# Altium project Sound_Sensor.PrjPcb (part 4 of 4)

## Sheet Sensor_Sheet_2.SchDoc
size A4; DocumentNumber: 4; SheetNumber: 4; SheetTotal: 11
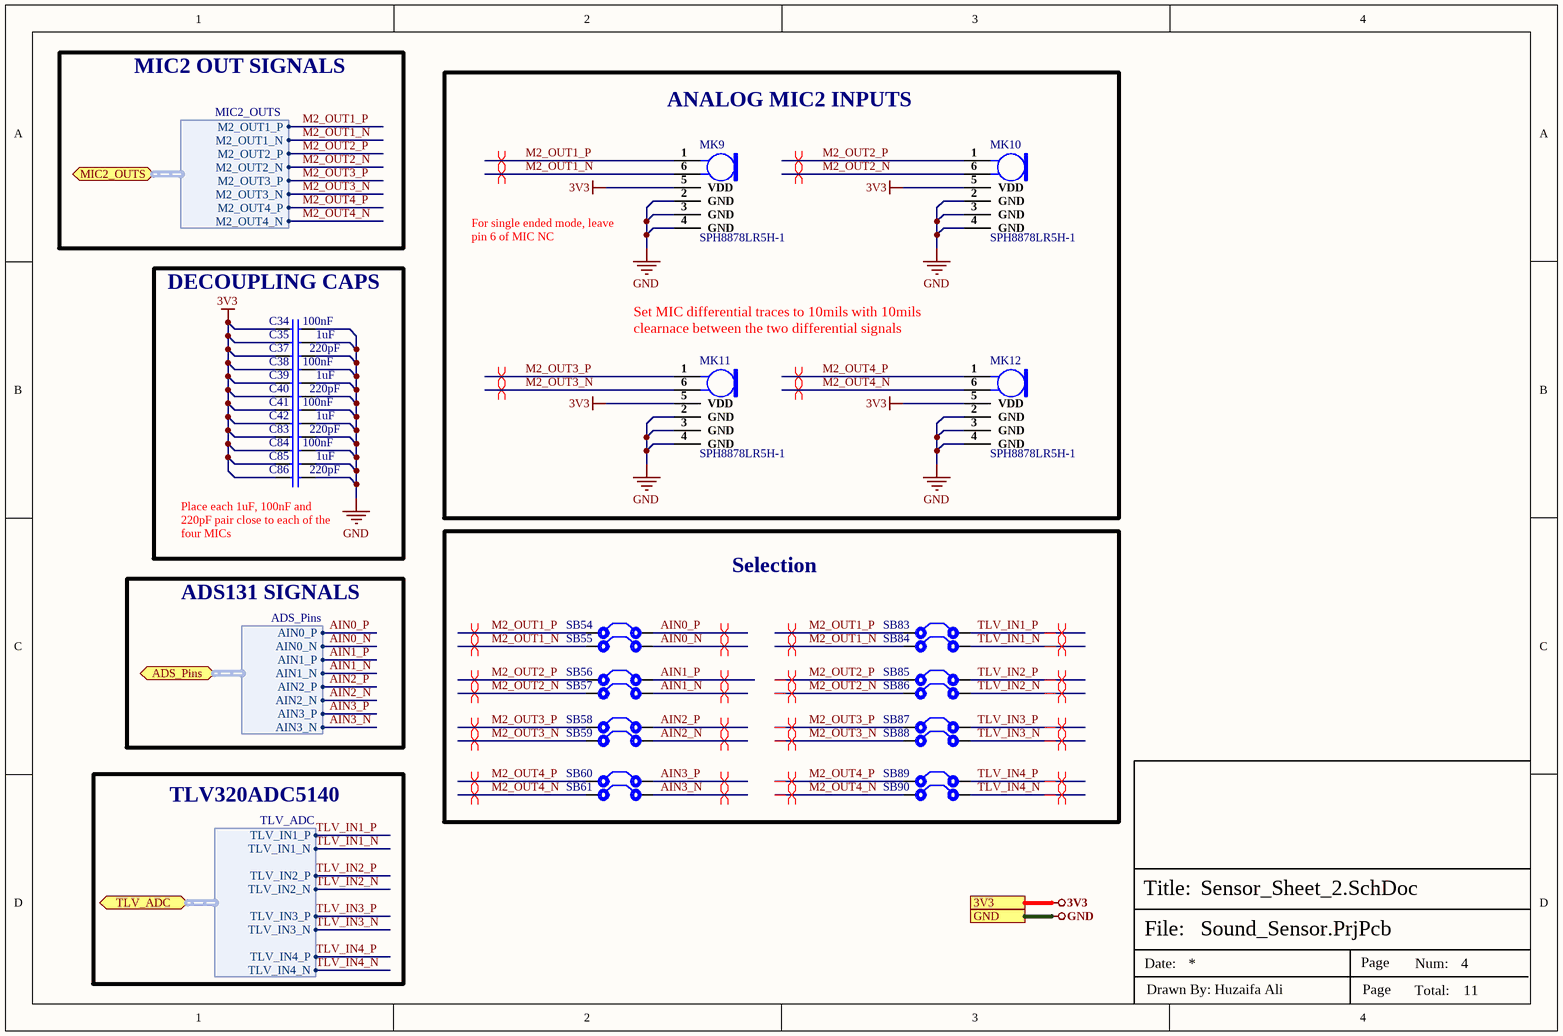
[diagram p9: Sensor_Sheet_2.SchDoc]

### Parts
C34  100nF  [Cap-0603]
C35  1uF  [Cap-0402]
C37  220pF  [Cap 0402]
C38  100nF  [Cap-0603]
C39  1uF  [Cap-0402]
C40  220pF  [Cap 0402]
C41  100nF  [Cap-0603]
C42  1uF  [Cap-0402]
C83  220pF  [Cap 0402]
C84  100nF  [Cap-0603]
C85  1uF  [Cap-0402]
C86  220pF  [Cap 0402]
MK9  SPH8878LR5H-1  [SPH8878LR5H-1]
MK10  SPH8878LR5H-1  [SPH8878LR5H-1]
MK11  SPH8878LR5H-1  [SPH8878LR5H-1]
MK12  SPH8878LR5H-1  [SPH8878LR5H-1]
SB54  Solder Bridge  [Solder Bridge]  (value not drawn)
SB55  Solder Bridge  [Solder Bridge]  (value not drawn)
SB56  Solder Bridge  [Solder Bridge]  (value not drawn)
SB57  Solder Bridge  [Solder Bridge]  (value not drawn)
SB58  Solder Bridge  [Solder Bridge]  (value not drawn)
SB59  Solder Bridge  [Solder Bridge]  (value not drawn)
SB60  Solder Bridge  [Solder Bridge]  (value not drawn)
SB61  Solder Bridge  [Solder Bridge]  (value not drawn)
SB83  Solder Bridge  [Solder Bridge]  (value not drawn)
SB84  Solder Bridge  [Solder Bridge]  (value not drawn)
SB85  Solder Bridge  [Solder Bridge]  (value not drawn)
SB86  Solder Bridge  [Solder Bridge]  (value not drawn)
SB87  Solder Bridge  [Solder Bridge]  (value not drawn)
SB88  Solder Bridge  [Solder Bridge]  (value not drawn)
SB89  Solder Bridge  [Solder Bridge]  (value not drawn)
SB90  Solder Bridge  [Solder Bridge]  (value not drawn)

### Blocks framed on the sheet
ANALOG MIC2 INPUTS: MK9-MK12
DECOUPLING CAPS: C34 C35 C37-C42 C83-C86
Selection: SB54-SB61 SB83-SB90

### Ports
3V3, ADS_Pins (bidir, harness ADS_Pins), GND, MIC2_OUTS (bidir, harness MIC2_OUTS), TLV_ADC (bidir, harness TLV_ADC)

### Harnesses
ADS_Pins: AIN2_P, AIN2_N, AIN3_N, AIN3_P, AIN0_P, AIN0_N, AIN1_N, AIN1_P
TLV_ADC: TLV_IN1_P, TLV_IN1_N, TLV_IN2_P, TLV_IN2_N, TLV_IN3_P, TLV_IN3_N, TLV_IN4_P, TLV_IN4_N
MIC2_OUTS: M2_OUT2_P, M2_OUT1_P, M2_OUT1_N, M2_OUT2_N, M2_OUT4_P, M2_OUT3_P, M2_OUT3_N, M2_OUT4_N

### Nets
3V3: C34.1 C35.1 C37.1 C38.1 C39.1 C40.1 C41.1 C42.1 C83.1 C84.1 C85.1 C86.1 MK9.5(VDD) MK10.5(VDD) MK11.5(VDD) MK12.5(VDD) ; port 3V3
GND: C34.2 C35.2 C37.2 C38.2 C39.2 C40.2 C41.2 C42.2 C83.2 C84.2 C85.2 C86.2 MK9.2(GND) MK9.3(GND) MK9.4(GND) MK10.2(GND) MK10.3(GND) MK10.4(GND) MK11.2(GND) MK11.3(GND) MK11.4(GND) MK12.2(GND) MK12.3(GND) MK12.4(GND) ; port GND
AIN0_N: SB55.2 ; port ADS_Pins.AIN0_N  [project net ADS_Pins.AIN0_N]
AIN0_P: SB54.2 ; port ADS_Pins.AIN0_P  [project net ADS_Pins.AIN0_P]
AIN1_N: SB57.2 ; port ADS_Pins.AIN1_N  [project net ADS_Pins.AIN1_N]
AIN1_P: SB56.2 ; port ADS_Pins.AIN1_P  [project net ADS_Pins.AIN1_P]
AIN2_N: SB59.2 ; port ADS_Pins.AIN2_N  [project net ADS_Pins.AIN2_N]
AIN2_P: SB58.2 ; port ADS_Pins.AIN2_P  [project net ADS_Pins.AIN2_P]
AIN3_N: SB61.2 ; port ADS_Pins.AIN3_N  [project net ADS_Pins.AIN3_N]
AIN3_P: SB60.2 ; port ADS_Pins.AIN3_P  [project net ADS_Pins.AIN3_P]
M2_OUT1_N: MK9.6(OUT-) SB55.1 SB84.1 ; port MIC2_OUTS.M2_OUT1_N
M2_OUT1_P: MK9.1(OUT+) SB54.1 SB83.1 ; port MIC2_OUTS.M2_OUT1_P
M2_OUT2_N: MK10.6(OUT-) SB57.1 SB86.1 ; port MIC2_OUTS.M2_OUT2_N
M2_OUT2_P: MK10.1(OUT+) SB56.1 SB85.1 ; port MIC2_OUTS.M2_OUT2_P
M2_OUT3_N: MK11.6(OUT-) SB59.1 SB88.1 ; port MIC2_OUTS.M2_OUT3_N
M2_OUT3_P: MK11.1(OUT+) SB58.1 SB87.1 ; port MIC2_OUTS.M2_OUT3_P
M2_OUT4_N: MK12.6(OUT-) SB61.1 SB90.1 ; port MIC2_OUTS.M2_OUT4_N
M2_OUT4_P: MK12.1(OUT+) SB60.1 SB89.1 ; port MIC2_OUTS.M2_OUT4_P
TLV_IN1_N: SB84.2 ; port TLV_ADC.TLV_IN1_N  [project net TLV_ADC.TLV_IN1_N]
TLV_IN1_P: SB83.2 ; port TLV_ADC.TLV_IN1_P  [project net TLV_ADC.TLV_IN1_P]
TLV_IN2_N: SB86.2 ; port TLV_ADC.TLV_IN2_N  [project net TLV_ADC.TLV_IN2_N]
TLV_IN2_P: SB85.2 ; port TLV_ADC.TLV_IN2_P  [project net TLV_ADC.TLV_IN2_P]
TLV_IN3_N: SB88.2 ; port TLV_ADC.TLV_IN3_N  [project net TLV_ADC.TLV_IN3_N]
TLV_IN3_P: SB87.2 ; port TLV_ADC.TLV_IN3_P  [project net TLV_ADC.TLV_IN3_P]
TLV_IN4_N: SB90.2 ; port TLV_ADC.TLV_IN4_N  [project net TLV_ADC.TLV_IN4_N]
TLV_IN4_P: SB89.2 ; port TLV_ADC.TLV_IN4_P  [project net TLV_ADC.TLV_IN4_P]

### Layout directives
differential pair; net class OUT1; differential pair class OUT1_Lines: M2_OUT1_N, M2_OUT1_P, M2_OUT2_N, M2_OUT2_P, M2_OUT3_N, M2_OUT3_P, M2_OUT4_N, M2_OUT4_P
differential pair; net class AIN0; differential pair class AIN0_Lines: ADS_Pins.AIN0_N, ADS_Pins.AIN0_P
differential pair; net class AIN1; differential pair class AIN1_Lines: ADS_Pins.AIN1_N, ADS_Pins.AIN1_P
differential pair; net class AIN2; differential pair class AIN2_Lines: ADS_Pins.AIN2_N, ADS_Pins.AIN2_P
differential pair; net class AIN3; differential pair class AIN3_Lines: ADS_Pins.AIN3_N, ADS_Pins.AIN3_P
differential pair; net class M2_OUT1; differential pair class M2_OUT1_Lines: M2_OUT1_N, M2_OUT1_P
differential pair; net class M2_OUT2; differential pair class M2_OUT2_Lines: M2_OUT2_N, M2_OUT2_P
differential pair; net class M2_OUT3; differential pair class M2_OUT3_Lines: M2_OUT3_N, M2_OUT3_P
differential pair; net class M2_OUT4; differential pair class M2_OUT4_Lines: M2_OUT4_N, M2_OUT4_P
differential pair; net class TLV_IN1; differential pair class TLV_IN1_Lines: TLV_ADC.TLV_IN1_N, TLV_ADC.TLV_IN1_P
differential pair; net class TLV_IN2; differential pair class TLV_IN2_Lines: TLV_ADC.TLV_IN2_N, TLV_ADC.TLV_IN2_P
differential pair; net class TLV_IN3; differential pair class TLV_IN3_Lines: TLV_ADC.TLV_IN3_N, TLV_ADC.TLV_IN3_P
differential pair; net class TLV_IN4; differential pair class TLV_IN4_Lines: TLV_ADC.TLV_IN4_N, TLV_ADC.TLV_IN4_P

### Notes on the sheet
- MIC2 OUT SIGNALS
- For single ended mode, leave pin 6 of MIC NC
- (near MK11) Set MIC differential traces to 10mils with 10mils clearnace between the two differential signals
- Place each 1uF, 100nF and 220pF pair close to each of the four MICs
- ADS131 SIGNALS
- TLV320ADC5140
- File:
- Title:
- Date:
- Page
- Num:
- Total:
- Drawn By: Huzaifa Ali

### Library data of the parts
C34 C38 C41 C84 = CC0603KRX5R9BB104: CAP CER 0.1UF 50V X5R 0603; Manufacturer: Yageo; Tolerance: 10%; Item Type: Capacitor; Supplier 1: Digi-Key; Manufacturer Part Number: CC0603KRX5R9BB104; RoHS: Yes; Category: Ceramic Capacitors; Stock 1: 152253; Pricing 1: 1=0.10000, 10=0.05200, 50=0.02820, 100=0.02310, 500=0.01648, 1000=0.01294 (USD); Mount: Surface Mount; Case/Package: 0603; Case Code (Imperial): 0603; Case Code (Metric): 1608; Weight: 7.1E-05oz; Min Operating Temperature: -55°C; Max Operating Temperature: 85°C; Capacitance: 100nF; Packaging: Tape and Reel; Voltage Rating: 50V; Dielectric: X5R; Termination: SMD/SMT; Voltage Rating (DC): 50V; Package Quantity: 4000; Length: 0.063inch; Width: 0.031inch; Thickness: 0.035inch; Lead Free: Lead Free; Halogen Free: Halogen Free; ComponentLink1URL: http://www.mouser.com/ds/2/447/Yageo_UPY-GP_NP0_16V-to-50V_9-358835.pdf?src-supplier=Mouser; ComponentLink1Description: http://www.mouser.com/ds/2/447/Yageo_UPY-GP_NP0_16V-to-50V_9-358835.pdf?src-supplier=Mouser; ComponentLink2URL: https://www.yageo.com/upload/media/product/productsearch/datasheet/mlcc/UPY-GPHC_X5R_4V-to-50V_26.pdf?src-supplier=Digi-Key; ComponentLink2Description: https://www.yageo.com/upload/media/product/productsearch/datasheet/mlcc/UPY-GPHC_X5R_4V-to-50V_26.pdf?src-supplier=Digi-Key; ComponentLink3URL: http://www.yageo.com/exep/pages/download/literatures/ProductSelectionGuide%202014_Final_2.pdf?src-supplier=Digi-Key; ComponentLink3Description: http://www.yageo.com/exep/pages/download/literatures/ProductSelectionGuide%202014_Final_2.pdf?src-supplier=Digi-Key; Supplier Part Number 1: 311-4046-1-ND; LCSC Part Number: C110022
C35 C39 C42 C85 = CC0402KRX5R8BB105: CAP CER 1UF 25V X5R 0402; Manufacturer: Yageo; Tolerance: 10%; Supplier 1: Mouser; Manufacturer Part Number: CC0402KRX5R8BB105; RoHS: Yes; Category: Ceramic Capacitors; Stock 1: 91975; Pricing 1: 1=0.30000, 10=0.20400, 50=0.20400, 100=0.11600, 1000=0.07200, 10000=0.05900 (USD); Mount: Surface Mount; Case/Package: 0402; Case Code (Metric): 1005; Case Code (Imperial): 0402; Weight: 2.3E-05oz; Min Operating Temperature: -55°C; Max Operating Temperature: 85°C; Packaging: Tape and Reel; Capacitance: 1uF; Voltage Rating: 25V; Dielectric: X5R; Termination: SMD/SMT; Voltage Rating (DC): 25V; Package Quantity: 10000; Length: 0.039inch; Width: 0.02inch; Thickness: 0.022inch; Lead Free: Lead Free; Halogen Free: Halogen Free; RoHS Compliant: Yes; ComponentLink1URL: http://www.mouser.com/ds/2/447/Yageo_UPY-GP_NP0_16V-to-50V_9-358835.pdf?src-supplier=Mouser; ComponentLink1Description: http://www.mouser.com/ds/2/447/Yageo_UPY-GP_NP0_16V-to-50V_9-358835.pdf?src-supplier=Mouser; ComponentLink2URL: http://www.yageo.com/documents/recent/UPY-GPHC_X5R_4V-to-50V_25.pdf?src-supplier=Digi-Key; ComponentLink2Description: http://www.yageo.com/documents/recent/UPY-GPHC_X5R_4V-to-50V_25.pdf?src-supplier=Digi-Key; ComponentLink3URL: https://4donline.ihs.com/images/VipMasterIC/IC/YAGO/YAGO-S-A0006851646/YAGO-S-A0006851646-1.pdf?hkey=6D3A4C79FDBF58556ACFDE234799DDF0&src-supplier=Newark; ComponentLink3Description: https://4donline.ihs.com/images/VipMasterIC/IC/YAGO/YAGO-S-A0006851646/YAGO-S-A0006851646-1.pdf?hkey=6D3A4C79FDBF58556ACFDE234799DDF0&src-supplier=Newark; Supplier Part Number 1: 603-CC402KRX5R8BB105; LCSC Part Number: C326568
C37 C40 C83 C86 = CC0402JRNPO9BN221: CAP CER 220PF 50V C0G/NPO 0402; Manufacturer: Yageo; Dielectric Material: Ceramic; Tolerance: 10%; Dielectric: C0G; Temperature Coefficient: 30ppm/°C; Insulation Resistance: 10GR; Dissipation Factor: 0.1%; Supplier 1: RSComponents; Manufacturer Part Number: CC0402JRNPO9BN221; RoHS: Yes; Category: Ceramic Capacitors; Stock 1: 20000; Pricing 1: 10000=0.00600, 100000=0.00600 (GBP); Mount: Surface Mount; Case/Package: 0402; Number of Pins: 2; Case Code (Metric): 1005; Case Code (Imperial): 0402; Min Operating Temperature: -55°C; Max Operating Temperature: 125°C; Capacitance: 220pF; Package Quantity: 1; Voltage Rating: 50V; Packaging: Tape and Reel; Termination: SMD/SMT; Voltage: 50V; Series: CC; Length: 1mm; Width: 0.02inch; Height: 0.5mm; Thickness: 0.022inch; Depth: 0.5mm; Radiation Hardening: No; RoHS Compliant: Yes; REACH SVHC: No SVHC; Lead Free: Lead Free; ComponentLink1URL: https://datasheet.ciiva.com/11786/0900766b8079c870-11786154.pdf?src-supplier=RSComponents; ComponentLink1Description: https://datasheet.ciiva.com/11786/0900766b8079c870-11786154.pdf?src-supplier=RSComponents; ComponentLink2URL: https://datasheet.ciiva.com/7656/1132289-7656616.pdf?src-supplier=Element14; ComponentLink2Description: https://datasheet.ciiva.com/7656/1132289-7656616.pdf?src-supplier=Element14; ComponentLink3URL: https://datasheet.ciiva.com/8033/1443161-8033609.pdf?src-supplier=Element14; ComponentLink3Description: https://datasheet.ciiva.com/8033/1443161-8033609.pdf?src-supplier=Element14; ComponentLink4URL: https://datasheet.ciiva.com/8033/1443161-8033608.pdf?src-supplier=Element14; ComponentLink4Description: https://datasheet.ciiva.com/8033/1443161-8033608.pdf?src-supplier=Element14; ComponentLink5URL: https://datasheet.ciiva.com/176/mlccorderingcode-176384.pdf?src-supplier=Digi-Key; ComponentLink5Description: https://datasheet.ciiva.com/176/mlccorderingcode-176384.pdf?src-supplier=Digi-Key; ComponentLink6URL: https://datasheet.ciiva.com/176/mlccorderingcode-176383.pdf?src-supplier=Digi-Key; ComponentLink6Description: https://datasheet.ciiva.com/176/mlccorderingcode-176383.pdf?src-supplier=Digi-Key; ComponentLink7URL: https://datasheet.ciiva.com/176/mlccorderingcode-176385.pdf?src-supplier=Digi-Key; ComponentLink7Description: https://datasheet.ciiva.com/176/mlccorderingcode-176385.pdf?src-supplier=Digi-Key; ComponentLink8URL: https://datasheet.ciiva.com/17434/upy-gp-np0-16v-to-50v-8-17434343.pdf?src-supplier=Avnet+Europe; ComponentLink8Description: https://datasheet.ciiva.com/17434/upy-gp-np0-16v-to-50v-8-17434343.pdf?src-supplier=Avnet+Europe; Supplier Part Number 1: 6169284
MK9-MK12 = SPH8878LR5H-1: Lovato Analog Bottom Port Mic; Manufacturer: Knowles; Item Type: Microphone; Supplier 1: Digi-Key; Manufacturer Part Number: SPH8878LR5H-1; RoHS: No; Category: Microphones; Stock 1: 1676; Pricing 1: 1=1.45000, 10=1.20800, 25=1.11760, 50=1.05220, 100=0.98880, 500=0.85076, 1000=0.79529 (USD); Supplier Part Number 1: 423-SPH8878LR5H-1CT-ND; LCSC Part Number: *
SB54-SB61 SB83-SB90 = Solder Bridge: Solder Bridge ON

## Sheet Diff_Amplifier_Sheet.SchDoc
size A4; DocumentNumber: 11; SheetNumber: 11; SheetTotal: 11
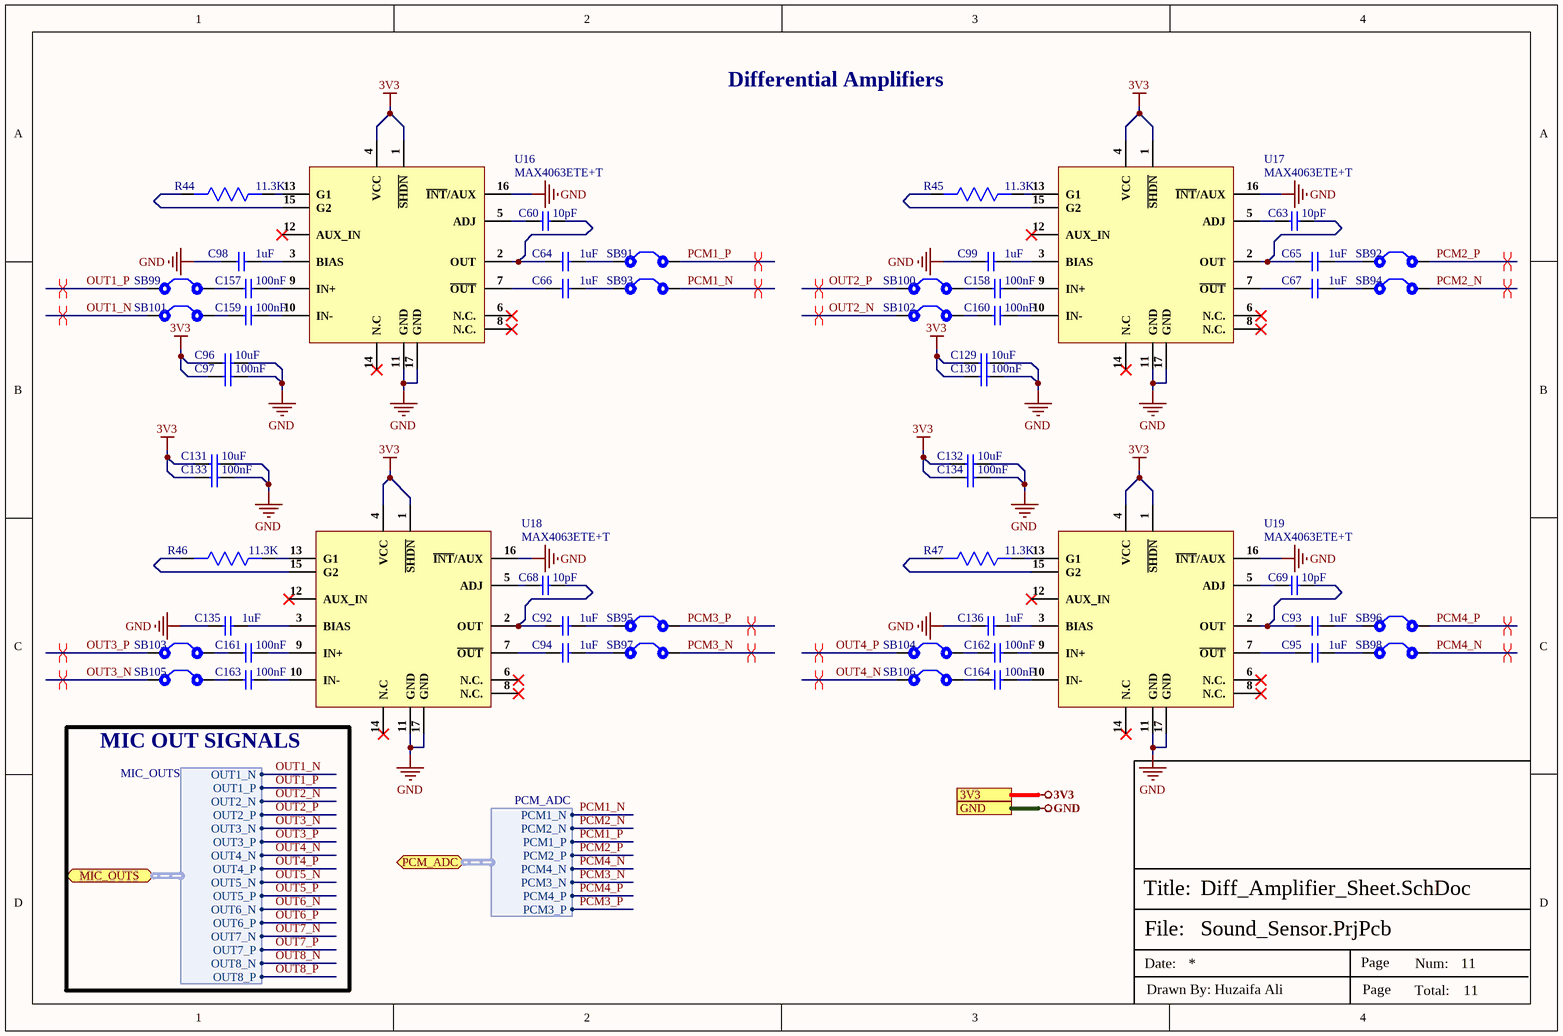
[diagram p10: Diff_Amplifier_Sheet.SchDoc]

### Parts
C60  10pF  [Cap-0603]
C63  10pF  [Cap-0603]
C64  1uF  [Cap-0402]
C65  1uF  [Cap-0402]
C66  1uF  [Cap-0402]
C67  1uF  [Cap-0402]
C68  10pF  [Cap-0603]
C69  10pF  [Cap-0603]
C92  1uF  [Cap-0402]
C93  1uF  [Cap-0402]
C94  1uF  [Cap-0402]
C95  1uF  [Cap-0402]
C96  10uF  [Cap-0603]
C97  100nF  [Cap-0402]
C98  1uF  [Cap-0402]
C99  1uF  [Cap-0402]
C129  10uF  [Cap-0603]
C130  100nF  [Cap-0402]
C131  10uF  [Cap-0603]
C132  10uF  [Cap-0603]
C133  100nF  [Cap-0402]
C134  100nF  [Cap-0402]
C135  1uF  [Cap-0402]
C136  1uF  [Cap-0402]
C157  100nF  [Cap-0402]
C158  100nF  [Cap-0402]
C159  100nF  [Cap-0402]
C160  100nF  [Cap-0402]
C161  100nF  [Cap-0402]
C162  100nF  [Cap-0402]
C163  100nF  [Cap-0402]
C164  100nF  [Cap-0402]
R44  11.3K  [Res-0603]
R45  11.3K  [Res-0603]
R46  11.3K  [Res-0603]
R47  11.3K  [Res-0603]
SB91  Solder Bridge  [Solder Bridge]  (value not drawn)
SB92  Solder Bridge  [Solder Bridge]  (value not drawn)
SB93  Solder Bridge  [Solder Bridge]  (value not drawn)
SB94  Solder Bridge  [Solder Bridge]  (value not drawn)
SB95  Solder Bridge  [Solder Bridge]  (value not drawn)
SB96  Solder Bridge  [Solder Bridge]  (value not drawn)
SB97  Solder Bridge  [Solder Bridge]  (value not drawn)
SB98  Solder Bridge  [Solder Bridge]  (value not drawn)
SB99  Solder Bridge  [Solder Bridge]  (value not drawn)
SB100  Solder Bridge  [Solder Bridge]  (value not drawn)
SB101  Solder Bridge  [Solder Bridge]  (value not drawn)
SB102  Solder Bridge  [Solder Bridge]  (value not drawn)
SB103  Solder Bridge  [Solder Bridge]  (value not drawn)
SB104  Solder Bridge  [Solder Bridge]  (value not drawn)
SB105  Solder Bridge  [Solder Bridge]  (value not drawn)
SB106  Solder Bridge  [Solder Bridge]  (value not drawn)
U16  MAX4063ETE+T  [16-TQFN (4x4)]
U17  MAX4063ETE+T  [16-TQFN (4x4)]
U18  MAX4063ETE+T  [16-TQFN (4x4)]
U19  MAX4063ETE+T  [16-TQFN (4x4)]

### Ports
3V3, GND, MIC_OUTS (bidir, harness MIC_OUTS), PCM_ADC (bidir, harness PCM_ADC)

### Harnesses
MIC_OUTS: OUT1_N, OUT1_P, OUT2_N, OUT2_P, OUT3_N, OUT3_P, OUT4_N, OUT4_P, OUT5_N, OUT5_P, OUT6_N, OUT6_P, OUT7_N, OUT7_P, OUT8_N, OUT8_P
PCM_ADC: PCM1_N, PCM2_N, PCM1_P, PCM2_P, PCM4_N, PCM3_N, PCM4_P, PCM3_P

### Nets
3V3: C96.1 C97.1 C129.1 C130.1 C131.1 C132.1 C133.1 C134.1 U16.1(~{SHDN}) U16.4(VCC) U17.1(~{SHDN}) U17.4(VCC) U18.1(~{SHDN}) U18.4(VCC) U19.1(~{SHDN}) U19.4(VCC) ; port 3V3
GND: C96.2 C97.2 C98.1 C99.1 C129.2 C130.2 C131.2 C132.2 C133.2 C134.2 C135.1 C136.1 U16.11(GND) U16.16(~{INT}/AUX) U16.17(GND) U17.11(GND) U17.16(~{INT}/AUX) U17.17(GND) U18.11(GND) U18.16(~{INT}/AUX) U18.17(GND) U19.11(GND) U19.16(~{INT}/AUX) U19.17(GND) ; port GND
OUT1_N: SB101.1 ; port MIC_OUTS.OUT1_N  [project net MIC_OUTS.OUT1_N]
OUT1_P: SB99.1 ; port MIC_OUTS.OUT1_P  [project net MIC_OUTS.OUT1_P]
OUT2_N: SB102.1 ; port MIC_OUTS.OUT2_N  [project net MIC_OUTS.OUT2_N]
OUT2_P: SB100.1 ; port MIC_OUTS.OUT2_P  [project net MIC_OUTS.OUT2_P]
OUT3_N: SB105.1 ; port MIC_OUTS.OUT3_N  [project net MIC_OUTS.OUT3_N]
OUT3_P: SB103.1 ; port MIC_OUTS.OUT3_P  [project net MIC_OUTS.OUT3_P]
OUT4_N: SB106.1 ; port MIC_OUTS.OUT4_N  [project net MIC_OUTS.OUT4_N]
OUT4_P: SB104.1 ; port MIC_OUTS.OUT4_P  [project net MIC_OUTS.OUT4_P]
PCM1_N: SB93.2 ; port PCM_ADC.PCM1_N
PCM1_P: SB91.2 ; port PCM_ADC.PCM1_P
PCM2_N: SB94.2 ; port PCM_ADC.PCM2_N
PCM2_P: SB92.2 ; port PCM_ADC.PCM2_P
PCM3_N: SB97.2 ; port PCM_ADC.PCM3_N
PCM3_P: SB95.2 ; port PCM_ADC.PCM3_P
PCM4_N: SB98.2 ; port PCM_ADC.PCM4_N
PCM4_P: SB96.2 ; port PCM_ADC.PCM4_P
NetC60_1: C60.1 U16.5(ADJ)
NetC60_2: C60.2 C64.1 U16.2(OUT)
NetC63_1: C63.1 U17.5(ADJ)
NetC63_2: C63.2 C65.1 U17.2(OUT)
NetC64_2: C64.2 SB91.1
NetC65_2: C65.2 SB92.1
NetC66_1: C66.1 U16.7(~{OUT})
NetC66_2: C66.2 SB93.1
NetC67_1: C67.1 U17.7(~{OUT})
NetC67_2: C67.2 SB94.1
NetC68_1: C68.1 U18.5(ADJ)
NetC68_2: C68.2 C92.1 U18.2(OUT)
NetC69_1: C69.1 U19.5(ADJ)
NetC69_2: C69.2 C93.1 U19.2(OUT)
NetC92_2: C92.2 SB95.1
NetC93_2: C93.2 SB96.1
NetC94_1: C94.1 U18.7(~{OUT})
NetC94_2: C94.2 SB97.1
NetC95_1: C95.1 U19.7(~{OUT})
NetC95_2: C95.2 SB98.1
NetC98_2: C98.2 U16.3(BIAS)
NetC99_2: C99.2 U17.3(BIAS)
NetC135_2: C135.2 U18.3(BIAS)
NetC136_2: C136.2 U19.3(BIAS)
NetC157_1: C157.1 SB99.2
NetC157_2: C157.2 U16.9(IN+)
NetC158_1: C158.1 SB100.2
NetC158_2: C158.2 U17.9(IN+)
NetC159_1: C159.1 SB101.2
NetC159_2: C159.2 U16.10(IN-)
NetC160_1: C160.1 SB102.2
NetC160_2: C160.2 U17.10(IN-)
NetC161_1: C161.1 SB103.2
NetC161_2: C161.2 U18.9(IN+)
NetC162_1: C162.1 SB104.2
NetC162_2: C162.2 U19.9(IN+)
NetC163_1: C163.1 SB105.2
NetC163_2: C163.2 U18.10(IN-)
NetC164_1: C164.1 SB106.2
NetC164_2: C164.2 U19.10(IN-)
NetR44_1: R44.1 U16.13(G1)
NetR44_2: R44.2 U16.15(G2)
NetR45_1: R45.1 U17.13(G1)
NetR45_2: R45.2 U17.15(G2)
NetR46_1: R46.1 U18.13(G1)
NetR46_2: R46.2 U18.15(G2)
NetR47_1: R47.1 U19.13(G1)
NetR47_2: R47.2 U19.15(G2)

Not connected (* = marked no-connect by the designer): U16 6(N.C.)* 8(N.C.)* 12(AUX_IN)* 14(N.C)*; U17 6(N.C.)* 8(N.C.)* 12(AUX_IN)* 14(N.C)*; U18 6(N.C.)* 8(N.C.)* 12(AUX_IN)* 14(N.C)*; U19 6(N.C.)* 8(N.C.)* 12(AUX_IN)* 14(N.C)*

### Layout directives
differential pair; net class OUT1; differential pair class OUT1_Lines: MIC_OUTS.OUT1_N, MIC_OUTS.OUT1_P
differential pair; net class OUT3; differential pair class OUT3_Lines: MIC_OUTS.OUT3_N, MIC_OUTS.OUT3_P
differential pair; net class PCM3; differential pair class PCM3_Lines: PCM3_N, PCM3_P
differential pair; net class OUT4; differential pair class OUT4_Lines: MIC_OUTS.OUT4_N, MIC_OUTS.OUT4_P
differential pair; net class PCM4; differential pair class PCM4_Lines: PCM4_N, PCM4_P
differential pair; net class PCM1; differential pair class PCM1_Lines: PCM1_N, PCM1_P
differential pair; net class OUT2; differential pair class OUT2_Lines: MIC_OUTS.OUT2_N, MIC_OUTS.OUT2_P
differential pair; net class PCM2; differential pair class PCM2_Lines: PCM2_N, PCM2_P

### Notes on the sheet
- Differential Amplifiers
- MIC OUT SIGNALS
- File:
- Title:
- Date:
- Page
- Num:
- Total:
- Drawn By: Huzaifa Ali

### Library data of the parts
C60 C63 C68 C69 = CC0603JRNPO9BN100: CAP CER 10PF 50V C0G/NPO 0603; Manufacturer: Yageo; Tolerance: 5%; Dielectric: C0G; Temperature Coefficient: 30ppm/°C; Insulation Resistance: 100GR; ComponentLink1URL: https://datasheet.ciiva.com/25787/cl10a475ka8nqnc-25787017.pdf?src-supplier=Digi-Key; ComponentLink1Description: https://datasheet.ciiva.com/25787/cl10a475ka8nqnc-25787017.pdf?src-supplier=Digi-Key; ComponentLink2URL: https://datasheet.ciiva.com/144/mlccorderingcode-144651.pdf?src-supplier=Digi-Key; ComponentLink2Description: https://datasheet.ciiva.com/144/mlccorderingcode-144651.pdf?src-supplier=Digi-Key; ComponentLink3URL: https://datasheet.ciiva.com/11786/0900766b8079c870-11786407.pdf?src-supplier=RSComponents; ComponentLink3Description: https://datasheet.ciiva.com/11786/0900766b8079c870-11786407.pdf?src-supplier=RSComponents; ComponentLink4URL: https://datasheet.ciiva.com/5789/1734582-5789616.pdf?src-supplier=Farnell; ComponentLink4Description: https://datasheet.ciiva.com/5789/1734582-5789616.pdf?src-supplier=Farnell; ComponentLink5URL: https://datasheet.ciiva.com/26862/getdatasheetpartid-403524-26862758.pdf?src-supplier=Verical; ComponentLink5Description: https://datasheet.ciiva.com/26862/getdatasheetpartid-403524-26862758.pdf?src-supplier=Verical; ComponentLink6URL: https://datasheet.ciiva.com/7978/1132289-7978126.pdf?src-supplier=Element14; ComponentLink6Description: https://datasheet.ciiva.com/7978/1132289-7978126.pdf?src-supplier=Element14; ComponentLink7URL: https://datasheet.ciiva.com/46430/1835847-46430150.pdf?src-supplier=Element14; ComponentLink7Description: https://datasheet.ciiva.com/46430/1835847-46430150.pdf?src-supplier=Element14; ComponentLink8URL: https://datasheet.ciiva.com/144/mlccorderingcode-144650.pdf?src-supplier=Digi-Key; ComponentLink8Description: https://datasheet.ciiva.com/144/mlccorderingcode-144650.pdf?src-supplier=Digi-Key; ComponentLink9URL: https://datasheet.ciiva.com/144/mlccorderingcode-144649.pdf?src-supplier=Digi-Key; ComponentLink9Description: https://datasheet.ciiva.com/144/mlccorderingcode-144649.pdf?src-supplier=Digi-Key; ComponentLink10URL: https://datasheet.ciiva.com/5425/upy-gp-np0-16v-to-50v-8-5425564.pdf?src-supplier=Mouser; ComponentLink10Description: https://datasheet.ciiva.com/5425/upy-gp-np0-16v-to-50v-8-5425564.pdf?src-supplier=Mouser; ComponentLink11URL: https://datasheet.ciiva.com/8033/1734582-8033710.pdf?src-supplier=Element14; ComponentLink11Description: https://datasheet.ciiva.com/8033/1734582-8033710.pdf?src-supplier=Element14; ComponentLink12URL: https://datasheet.ciiva.com/8033/1734582-8033706.pdf?src-supplier=Element14; ComponentLink12Description: https://datasheet.ciiva.com/8033/1734582-8033706.pdf?src-supplier=Element14; Supplier 1: Digi-Key; Manufacturer Part Number: CC0603JRNPO9BN100; RoHS: Yes; Category: Ceramic Capacitors; Stock 1: 1700978; Pricing 1: 1=0.10000, 10=0.03900, 50=0.02120, 100=0.01740, 500=0.01240, 1000=0.00974 (USD); Mount: Surface Mount; Case/Package: 0603; Number of Pins: 2; Case Code (Metric): 1608; Case Code (Imperial): 0603; Min Operating Temperature: -55°C; Max Operating Temperature: 125°C; Capacitance: 10pF; Voltage: 50V; Voltage Rating: 50V; Voltage Rating (DC): 50V; Packaging: Tape and Reel; Package Quantity: 1; Termination: SMD/SMT; Resistor Type: Ceramic; Series: CC; Length: 1.6mm; Width: 0.031inch; Height: 0.8mm; Thickness: 0.035inch; Depth: 0.8mm; Radiation Hardening: No; RoHS Compliant: Yes; REACH SVHC: No SVHC; Lead Free: Lead Free; Supplier Part Number 1: 311-1058-1-ND; LCSC Part Number: C106245
C64-C67 C92-C95 C98 C99 C135 C136 = CC0402KRX5R8BB105: as C35 on sheet Sensor_Sheet_2; Supplier 1: Mouser; Manufacturer Part Number: CC0402KRX5R8BB105; RoHS: Yes; Category: Ceramic Capacitors; Stock 1: 91975; Pricing 1: 1=0.30000, 10=0.20400, 50=0.20400, 100=0.11600, 1000=0.07200, 10000=0.05900 (USD); Mount: Surface Mount; Case/Package: 0402; Case Code (Metric): 1005; Case Code (Imperial): 0402; Weight: 2.3E-05oz; Min Operating Temperature: -55°C; Max Operating Temperature: 85°C; Packaging: Tape and Reel; Capacitance: 1uF; Voltage Rating: 25V; Dielectric: X5R; Termination: SMD/SMT; Voltage Rating (DC): 25V; Package Quantity: 10000; Length: 0.039inch; Width: 0.02inch; Thickness: 0.022inch; Lead Free: Lead Free; Halogen Free: Halogen Free; RoHS Compliant: Yes; ComponentLink1URL: http://www.mouser.com/ds/2/447/Yageo_UPY-GP_NP0_16V-to-50V_9-358835.pdf?src-supplier=Mouser; ComponentLink1Description: http://www.mouser.com/ds/2/447/Yageo_UPY-GP_NP0_16V-to-50V_9-358835.pdf?src-supplier=Mouser; ComponentLink2URL: http://www.yageo.com/documents/recent/UPY-GPHC_X5R_4V-to-50V_25.pdf?src-supplier=Digi-Key; ComponentLink2Description: http://www.yageo.com/documents/recent/UPY-GPHC_X5R_4V-to-50V_25.pdf?src-supplier=Digi-Key; ComponentLink3URL: https://4donline.ihs.com/images/VipMasterIC/IC/YAGO/YAGO-S-A0006851646/YAGO-S-A0006851646-1.pdf?hkey=6D3A4C79FDBF58556ACFDE234799DDF0&src-supplier=Newark; ComponentLink3Description: https://4donline.ihs.com/images/VipMasterIC/IC/YAGO/YAGO-S-A0006851646/YAGO-S-A0006851646-1.pdf?hkey=6D3A4C79FDBF58556ACFDE234799DDF0&src-supplier=Newark; Supplier Part Number 1: 603-CC402KRX5R8BB105; LCSC Part Number: C326568
C96 C129 C131 C132 = C1608X5R1E106M080AC: CAP CER 10UF 25V X5R 0603; Manufacturer: TDK; Dielectric Material: Ceramic; Tolerance: 20%; Supplier 1: Digi-Key; Manufacturer Part Number: C1608X5R1E106M080AC; Stock 1: 61681; Pricing 1: 1=0.96, 10=0.704, 100=0.483, 500=0.38238, 1000=0.322 (USD); Mount: Surface Mount; Case/Package: 0603; Weight: 7.1E-05oz; Case Code (Imperial): 0603; Case Code (Metric): 1608; Min Operating Temperature: -55°C; Max Operating Temperature: 85°C; Capacitance: 10uF; Packaging: Tape and Reel; Voltage Rating: 25V; Voltage Rating (DC): 25V; Termination: SMD/SMT; Package Quantity: 1; Dielectric: X5R; Composition: Ceramic; Length: 1.6mm; Height: 0.8mm; Width: 0.8mm; Thickness: 0.039inch; Depth: 0.8mm; Lead Free: Lead Free; REACH SVHC: No SVHC; Supplier Part Number 1: 445-9015-1-ND; LCSC Part Number: C2168289
C97 C130 C133 C134 C157-C164 = CC0402KRX5R7BB104: CAP CER 0.1UF 16V X5R 0402; Manufacturer: Yageo; Tolerance: 10%; Supplier 1: Mouser; Manufacturer Part Number: CC0402KRX5R7BB104; RoHS: Yes; Category: Ceramic Capacitors; Stock 1: 936792; Pricing 1: 1=0.10000, 10=0.02300, 50=0.02300, 100=0.01100, 1000=0.00600, 10000=0.00400 (USD); Mount: Surface Mount; Case/Package: 0402; Number of Pins: 2; Case Code (Metric): 1005; Case Code (Imperial): 0402; Min Operating Temperature: -55°C; Max Operating Temperature: 85°C; Capacitance: 100nF; Dielectric: X5R; Packaging: Tape and Reel; Voltage Rating: 16V; Package Quantity: 1; Voltage Rating (DC): 16V; Termination: SMD/SMT; Resistor Type: Ceramic; Series: CC; Construction: Flat; Length: 1mm; Width: 0.02inch; Height: 0.5mm; Thickness: 0.022inch; Depth: 0.5mm; Radiation Hardening: No; REACH SVHC: Unknown; Lead Free: Lead Free; Halogen Free: Halogen Free; RoHS Compliant: Yes; ComponentLink1URL: https://datasheet.ciiva.com/155/mlccorderingcode-155879.pdf?src-supplier=Digi-Key; ComponentLink1Description: https://datasheet.ciiva.com/155/mlccorderingcode-155879.pdf?src-supplier=Digi-Key; ComponentLink2URL: https://datasheet.ciiva.com/155/mlccorderingcode-155878.pdf?src-supplier=Digi-Key; ComponentLink2Description: https://datasheet.ciiva.com/155/mlccorderingcode-155878.pdf?src-supplier=Digi-Key; ComponentLink3URL: https://datasheet.ciiva.com/155/mlccorderingcode-155880.pdf?src-supplier=Digi-Key; ComponentLink3Description: https://datasheet.ciiva.com/155/mlccorderingcode-155880.pdf?src-supplier=Digi-Key; ComponentLink4URL: https://datasheet.ciiva.com/11464/upy-gphc-x5r-4v-to-50v-12-11464869.pdf?src-supplier=Avnet; ComponentLink4Description: https://datasheet.ciiva.com/11464/upy-gphc-x5r-4v-to-50v-12-11464869.pdf?src-supplier=Avnet; Supplier Part Number 1: 603-CC402KRX5R7BB104; LCSC Part Number: C106204
R44-R47 = RC0603FR-0711K3L: RES 11.3K OHM 1% 1/10W 0603; Manufacturer: Yageo; Power Rating: 100mW; Temperature Coefficient: 100ppm/°C; Resistance: 11.3kR; Voltage Rating: 50V; Working Voltage: 75V; Item Type: Resistor; Supplier 1: Arrow Electronics; Manufacturer Part Number: RC0603FR-0711K3L; RoHS: Yes; Category: Chip SMD Resistors; Stock 1: 26; Pricing 1: 1=0.05080, 10=0.01610, 25=0.01080 (USD); Case/Package: 0603; Case Code (Imperial): 0603; Case Code (Metric): 1608; Min Operating Temperature: -55°C; Max Operating Temperature: 155°C; Tolerance: 1%; Series: RC; Technology: THICK FILM; Packaging: Tape and Reel; Package Quantity: 1; Termination: SMD/SMT; Resistor Type: Thick Film; Number of Terminations: 2; Max Power Dissipation: 100mW; Voltage Rating (DC): 50V; Features: Moisture Resistant; Construction: Rectangular; Length: 1.6mm; Width: 0.8mm; Height: 0.022inch; Depth: 0.8mm; RoHS Compliant: Yes; Military Standard: Not; Lead Free: Lead Free; ComponentLink1URL: https://datasheet.ciiva.com/2454/pyu-r-int-thick-7-2454634.pdf?src-supplier=Digi-Key; ComponentLink1Description: https://datasheet.ciiva.com/2454/pyu-r-int-thick-7-2454634.pdf?src-supplier=Digi-Key; ComponentLink2URL: https://datasheet.ciiva.com/2454/pyu-r-int-thick-7-2454635.pdf?src-supplier=Digi-Key; ComponentLink2Description: https://datasheet.ciiva.com/2454/pyu-r-int-thick-7-2454635.pdf?src-supplier=Digi-Key; ComponentLink3URL: https://datasheet.ciiva.com/2454/pyu-r-int-thick-7-2454633.pdf?src-supplier=Digi-Key; ComponentLink3Description: https://datasheet.ciiva.com/2454/pyu-r-int-thick-7-2454633.pdf?src-supplier=Digi-Key; ComponentLink4URL: https://datasheet.ciiva.com/12558/rc0603-272842-12558680.pdf?src-supplier=Mouser; ComponentLink4Description: https://datasheet.ciiva.com/12558/rc0603-272842-12558680.pdf?src-supplier=Mouser; ComponentLink5URL: https://datasheet.ciiva.com/15189/getdatasheetpartid-326472-15189596.pdf?src-supplier=Verical; ComponentLink5Description: https://datasheet.ciiva.com/15189/getdatasheetpartid-326472-15189596.pdf?src-supplier=Verical; Supplier Part Number 1: RC0603FR-0711K3L; LCSC Part Number: C137803
SB91-SB106 = Solder Bridge: Solder Bridge ON
U16-U19 = MAX4063ETE+T: IC AMP CLASS AB STEREO 16TQFN; Manufacturer: Maxim; Voltage Gain: 26.02dB; Min Supply Voltage: 2.4V; Max Supply Voltage: 5.5V; Power Supply Rejection Ratio (PSRR): 95dB; Supplier 1: Mouser; Manufacturer Part Number: MAX4063ETE+T; RoHS: Yes; Category: Amplifiers - Audio; Stock 1: 23845; Pricing 1: 1=1.88000, 10=1.70000, 50=1.60000, 100=1.37000, 1000=0.96000, 10000=0.92700 (USD); Mount: Surface Mount; Number of Pins: 16; Min Operating Temperature: -40°C; Max Operating Temperature: 85°C; Package Quantity: 2500; Packaging: Tape and Reel; Series: -; Radiation Hardening: No; RoHS Compliant: Yes; ComponentLink1URL: https://datasheet.ciiva.com/1792/max4063-1792007.pdf?src-supplier=Digi-Key; ComponentLink1Description: https://datasheet.ciiva.com/1792/max4063-1792007.pdf?src-supplier=Digi-Key; ComponentLink2URL: https://datasheet.ciiva.com/2968/max4063-2968783.pdf?src-supplier=Avnet; ComponentLink2Description: https://datasheet.ciiva.com/2968/max4063-2968783.pdf?src-supplier=Avnet; Supplier Part Number 1: 700-MAX4063ETET; LCSC Part Number: *; Item Type: IC

## Nets that join several sheets
3V3: Sensor_Sheet (24 pins), Power_Section (C2.1 FB2.2), Controller_Sheet (13 pins), Connector_Sheet (P1.6), ADC_2_Section (11 pins), ADC_3_Section (8 pins), ADC_1_Section (9 pins), Amplifier_Sheet (16 pins), Sensor_Sheet_2 (16 pins), Diff_Amplifier_Sheet (16 pins)
5V: Power_Section (C#2.1 U3.1 U3.3), Connector_Sheet (D2.2 FB1.2)
GND: Sensor_Sheet (40 pins), Power_Section (C2.2 C#2.2 U3.2), Controller_Sheet (17 pins), Connector_Sheet (11 pins), ADC_2_Section (23 pins), ADC_3_Section (12 pins), ADC_1_Section (13 pins), Amplifier_Sheet (24 pins), Sensor_Sheet_2 (24 pins), Diff_Amplifier_Sheet (24 pins)
~{C}S: Controller_Sheet (SB5.2 U1.12), ADC_1_Section (R3.2 U4.17)
~{DRDY}: Controller_Sheet (SB49.1), ADC_1_Section (R2.2 U4.18)
ADC_I2S.BCKA: Controller_Sheet (U1.26), ADC_2_Section (SB76.1), ADC_3_Section (SB78.2)
ADC_I2S.BCKB: Controller_Sheet (U1.36), ADC_2_Section (U6.17)
ADC_I2S.DOUT1: Controller_Sheet (U1.10), ADC_2_Section (SB73.2), ADC_3_Section (SB79.2)
ADC_I2S.DOUT2: Controller_Sheet (U1.11), ADC_2_Section (U6.18)
ADC_I2S.LRCKA: Controller_Sheet (U1.8), ADC_2_Section (SB75.1), ADC_3_Section (SB77.1)
ADC_I2S.LRCKB: Controller_Sheet (U1.9), ADC_2_Section (U6.16)
ADC_I2S.SCKA: Controller_Sheet (SB7.1), ADC_2_Section (SB74.1), ADC_3_Section (SB80.1)
ADC_I2S.SCKB: Controller_Sheet (SB6.2), ADC_2_Section (U6.15)
ADS_Pins.AIN0_N: ADC_1_Section (SB23.2 U4.30), Sensor_Sheet_2 (SB55.2)
ADS_Pins.AIN0_P: ADC_1_Section (SB22.2 U4.29), Amplifier_Sheet (SB62.2 SB63.2), Sensor_Sheet_2 (SB54.2)
ADS_Pins.AIN1_N: ADC_1_Section (SB24.2 U4.31), Sensor_Sheet_2 (SB57.2)
ADS_Pins.AIN1_P: ADC_1_Section (SB25.2 U4.32), Amplifier_Sheet (SB64.2 SB65.2), Sensor_Sheet_2 (SB56.2)
ADS_Pins.AIN2_N: ADC_1_Section (SB11.2 U4.2), Sensor_Sheet_2 (SB59.2)
ADS_Pins.AIN2_P: ADC_1_Section (SB10.2 U4.1), Amplifier_Sheet (SB66.2 SB67.2), Sensor_Sheet_2 (SB58.2)
ADS_Pins.AIN3_N: ADC_1_Section (SB12.2 U4.3), Sensor_Sheet_2 (SB61.2)
ADS_Pins.AIN3_P: ADC_1_Section (SB13.2 U4.4), Amplifier_Sheet (SB68.2 SB69.2), Sensor_Sheet_2 (SB60.2)
DEBUG SIG.ENABLE: Controller_Sheet (5 pins), Connector_Sheet (P1.1)
DEBUG SIG.IO_0: Controller_Sheet (U1.25 U13.3), Connector_Sheet (P1.2)
DTR: Controller_Sheet (U13.2 U13.4), Connector_Sheet (J1.4)
INTA: Controller_Sheet (SB1.2), ADC_2_Section (U5.21)
INTA#: Controller_Sheet (SB3.2), ADC_2_Section (U6.21)
INTB: Controller_Sheet (SB4.2), ADC_2_Section (U5.20)
INTB#: Controller_Sheet (SB2.1 U1.33), ADC_2_Section (U6.20)
INTC: Controller_Sheet (SB5.1), ADC_2_Section (U5.19)
INTC#: Controller_Sheet (SB2.2), ADC_2_Section (U6.19)
M2_OUT1_P: Amplifier_Sheet (SB31.1), Sensor_Sheet_2 (MK9.1 SB54.1 SB83.1)
M2_OUT2_P: Amplifier_Sheet (SB33.1), Sensor_Sheet_2 (MK10.1 SB56.1 SB85.1)
M2_OUT3_P: Amplifier_Sheet (SB39.1), Sensor_Sheet_2 (MK11.1 SB58.1 SB87.1)
M2_OUT4_P: Amplifier_Sheet (SB52.1), Sensor_Sheet_2 (MK12.1 SB60.1 SB89.1)
MIC_OUTS.OUT1_N: Sensor_Sheet (MK1.6), ADC_2_Section (C141.1), ADC_1_Section (C105.1), Diff_Amplifier_Sheet (SB101.1)
MIC_OUTS.OUT1_P: Sensor_Sheet (MK1.1), ADC_2_Section (C143.1), ADC_1_Section (C104.1), Diff_Amplifier_Sheet (SB99.1)
MIC_OUTS.OUT2_N: Sensor_Sheet (MK2.6), ADC_2_Section (C142.1), ADC_1_Section (C106.1), Diff_Amplifier_Sheet (SB102.1)
MIC_OUTS.OUT2_P: Sensor_Sheet (MK2.1), ADC_2_Section (C144.1), ADC_1_Section (C107.1), Diff_Amplifier_Sheet (SB100.1)
MIC_OUTS.OUT3_N: Sensor_Sheet (MK3.6), ADC_2_Section (C146.1), ADC_1_Section (C46.1), Diff_Amplifier_Sheet (SB105.1)
MIC_OUTS.OUT3_P: Sensor_Sheet (MK3.1), ADC_2_Section (C148.1), ADC_1_Section (C45.1), Diff_Amplifier_Sheet (SB103.1)
MIC_OUTS.OUT4_N: Sensor_Sheet (MK4.6), ADC_2_Section (C145.1), ADC_1_Section (C47.1), Diff_Amplifier_Sheet (SB106.1)
MIC_OUTS.OUT4_P: Sensor_Sheet (MK4.1), ADC_2_Section (C147.1), ADC_1_Section (C48.1), Diff_Amplifier_Sheet (SB104.1)
MIC_OUTS.OUT5_N: Sensor_Sheet (MK5.6), ADC_2_Section (C149.1), ADC_1_Section (C50.1)
MIC_OUTS.OUT5_P: Sensor_Sheet (MK5.1), ADC_2_Section (C151.1), ADC_1_Section (C49.1)
MIC_OUTS.OUT6_N: Sensor_Sheet (MK6.6), ADC_2_Section (C150.1), ADC_1_Section (C51.1)
MIC_OUTS.OUT6_P: Sensor_Sheet (MK6.1), ADC_2_Section (C152.1), ADC_1_Section (C52.1)
MIC_OUTS.OUT7_N: Sensor_Sheet (MK7.6), ADC_2_Section (C154.1), ADC_1_Section (C101.1)
MIC_OUTS.OUT7_P: Sensor_Sheet (MK7.1), ADC_2_Section (C156.1), ADC_1_Section (C100.1)
MIC_OUTS.OUT8_N: Sensor_Sheet (MK8.6), ADC_2_Section (C153.1), ADC_1_Section (C102.1)
MIC_OUTS.OUT8_P: Sensor_Sheet (MK8.1), ADC_2_Section (C155.1), ADC_1_Section (C103.1)
MISO: Controller_Sheet (SB3.1 U1.31), ADC_1_Section (U4.20)
MOSI: Controller_Sheet (SB1.1 U1.37), ADC_1_Section (U4.21)
PCM1_N: ADC_2_Section (SB29.2 U5.1), Diff_Amplifier_Sheet (SB93.2)
PCM1_P: ADC_2_Section (SB32.2 U5.3), Diff_Amplifier_Sheet (SB91.2)
PCM2_N: ADC_2_Section (SB30.2 U5.2), Diff_Amplifier_Sheet (SB94.2)
PCM2_P: ADC_2_Section (SB34.2 U5.4), Diff_Amplifier_Sheet (SB92.2)
PCM3_N: ADC_2_Section (SB36.2 U5.28), Diff_Amplifier_Sheet (SB97.2)
PCM3_P: ADC_2_Section (SB38.2 U5.30), Diff_Amplifier_Sheet (SB95.2)
PCM4_N: ADC_2_Section (SB35.2 U5.27), Diff_Amplifier_Sheet (SB98.2)
PCM4_P: ADC_2_Section (SB37.2 U5.29), Diff_Amplifier_Sheet (SB96.2)
RTS: Controller_Sheet (U13.1 U13.5), Connector_Sheet (J1.3)
RX: Controller_Sheet (U1.34), Connector_Sheet (J1.1 P1.3)
SCL: Controller_Sheet (U1.13), ADC_2_Section (U5.24 U6.24), ADC_3_Section (R42.1 SB82.1)
SCLK: Controller_Sheet (SB4.1 U1.30), ADC_1_Section (U4.19)
SDA: Controller_Sheet (U1.16), ADC_2_Section (U5.23 U6.23), ADC_3_Section (R43.1 SB81.1)
TLV_ADC.TLV_IN1_N: ADC_3_Section (C25.1), Sensor_Sheet_2 (SB84.2)
TLV_ADC.TLV_IN1_P: ADC_3_Section (C24.1), Sensor_Sheet_2 (SB83.2)
TLV_ADC.TLV_IN2_N: ADC_3_Section (C32.1), Sensor_Sheet_2 (SB86.2)
TLV_ADC.TLV_IN2_P: ADC_3_Section (C30.1), Sensor_Sheet_2 (SB85.2)
TLV_ADC.TLV_IN3_N: ADC_3_Section (C166.1), Sensor_Sheet_2 (SB88.2)
TLV_ADC.TLV_IN3_P: ADC_3_Section (C165.1), Sensor_Sheet_2 (SB87.2)
TLV_ADC.TLV_IN4_N: ADC_3_Section (C168.1), Sensor_Sheet_2 (SB90.2)
TLV_ADC.TLV_IN4_P: ADC_3_Section (C167.1), Sensor_Sheet_2 (SB89.2)
TX: Controller_Sheet (U1.35), Connector_Sheet (J1.2 P1.4)